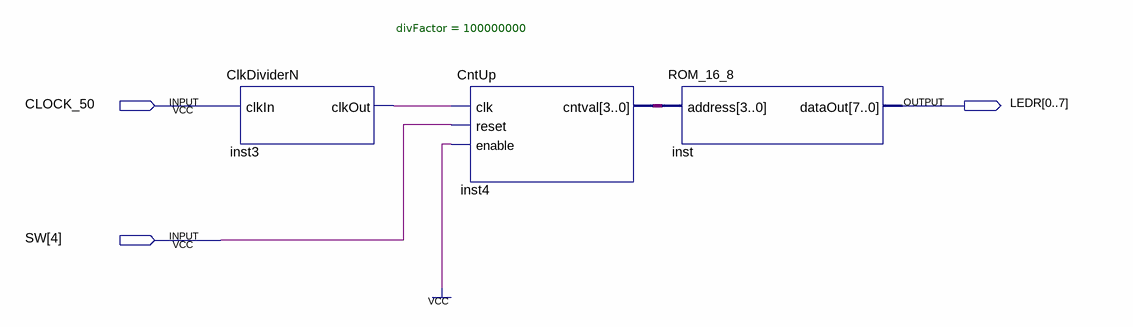
[diagram p0: schematic sheet]
// Quartus schematic ROM_Demo.bdf as structural Verilog: 3 symbols, 3 pins
module ROM_Demo (
  input  CLOCK_50,
  input  [4:4] SW,
  output [0:7] LEDR
);

  wire inst3_clkout;
  wire [3:0] inst4_cntval;

  ClkDividerN #(.divFactor(100000000)) inst3 (.clkIn(CLOCK_50), .clkOut(inst3_clkout));
  CntUp inst4 (.clk(inst3_clkout), .reset(SW[4]), .enable(1'b1), .cntval(inst4_cntval));
  ROM_16_8 inst (.address(inst4_cntval), .dataOut(LEDR));
endmodule
